# Altium project POD-Design-v1.1.PrjPcb (part 6 of 6)
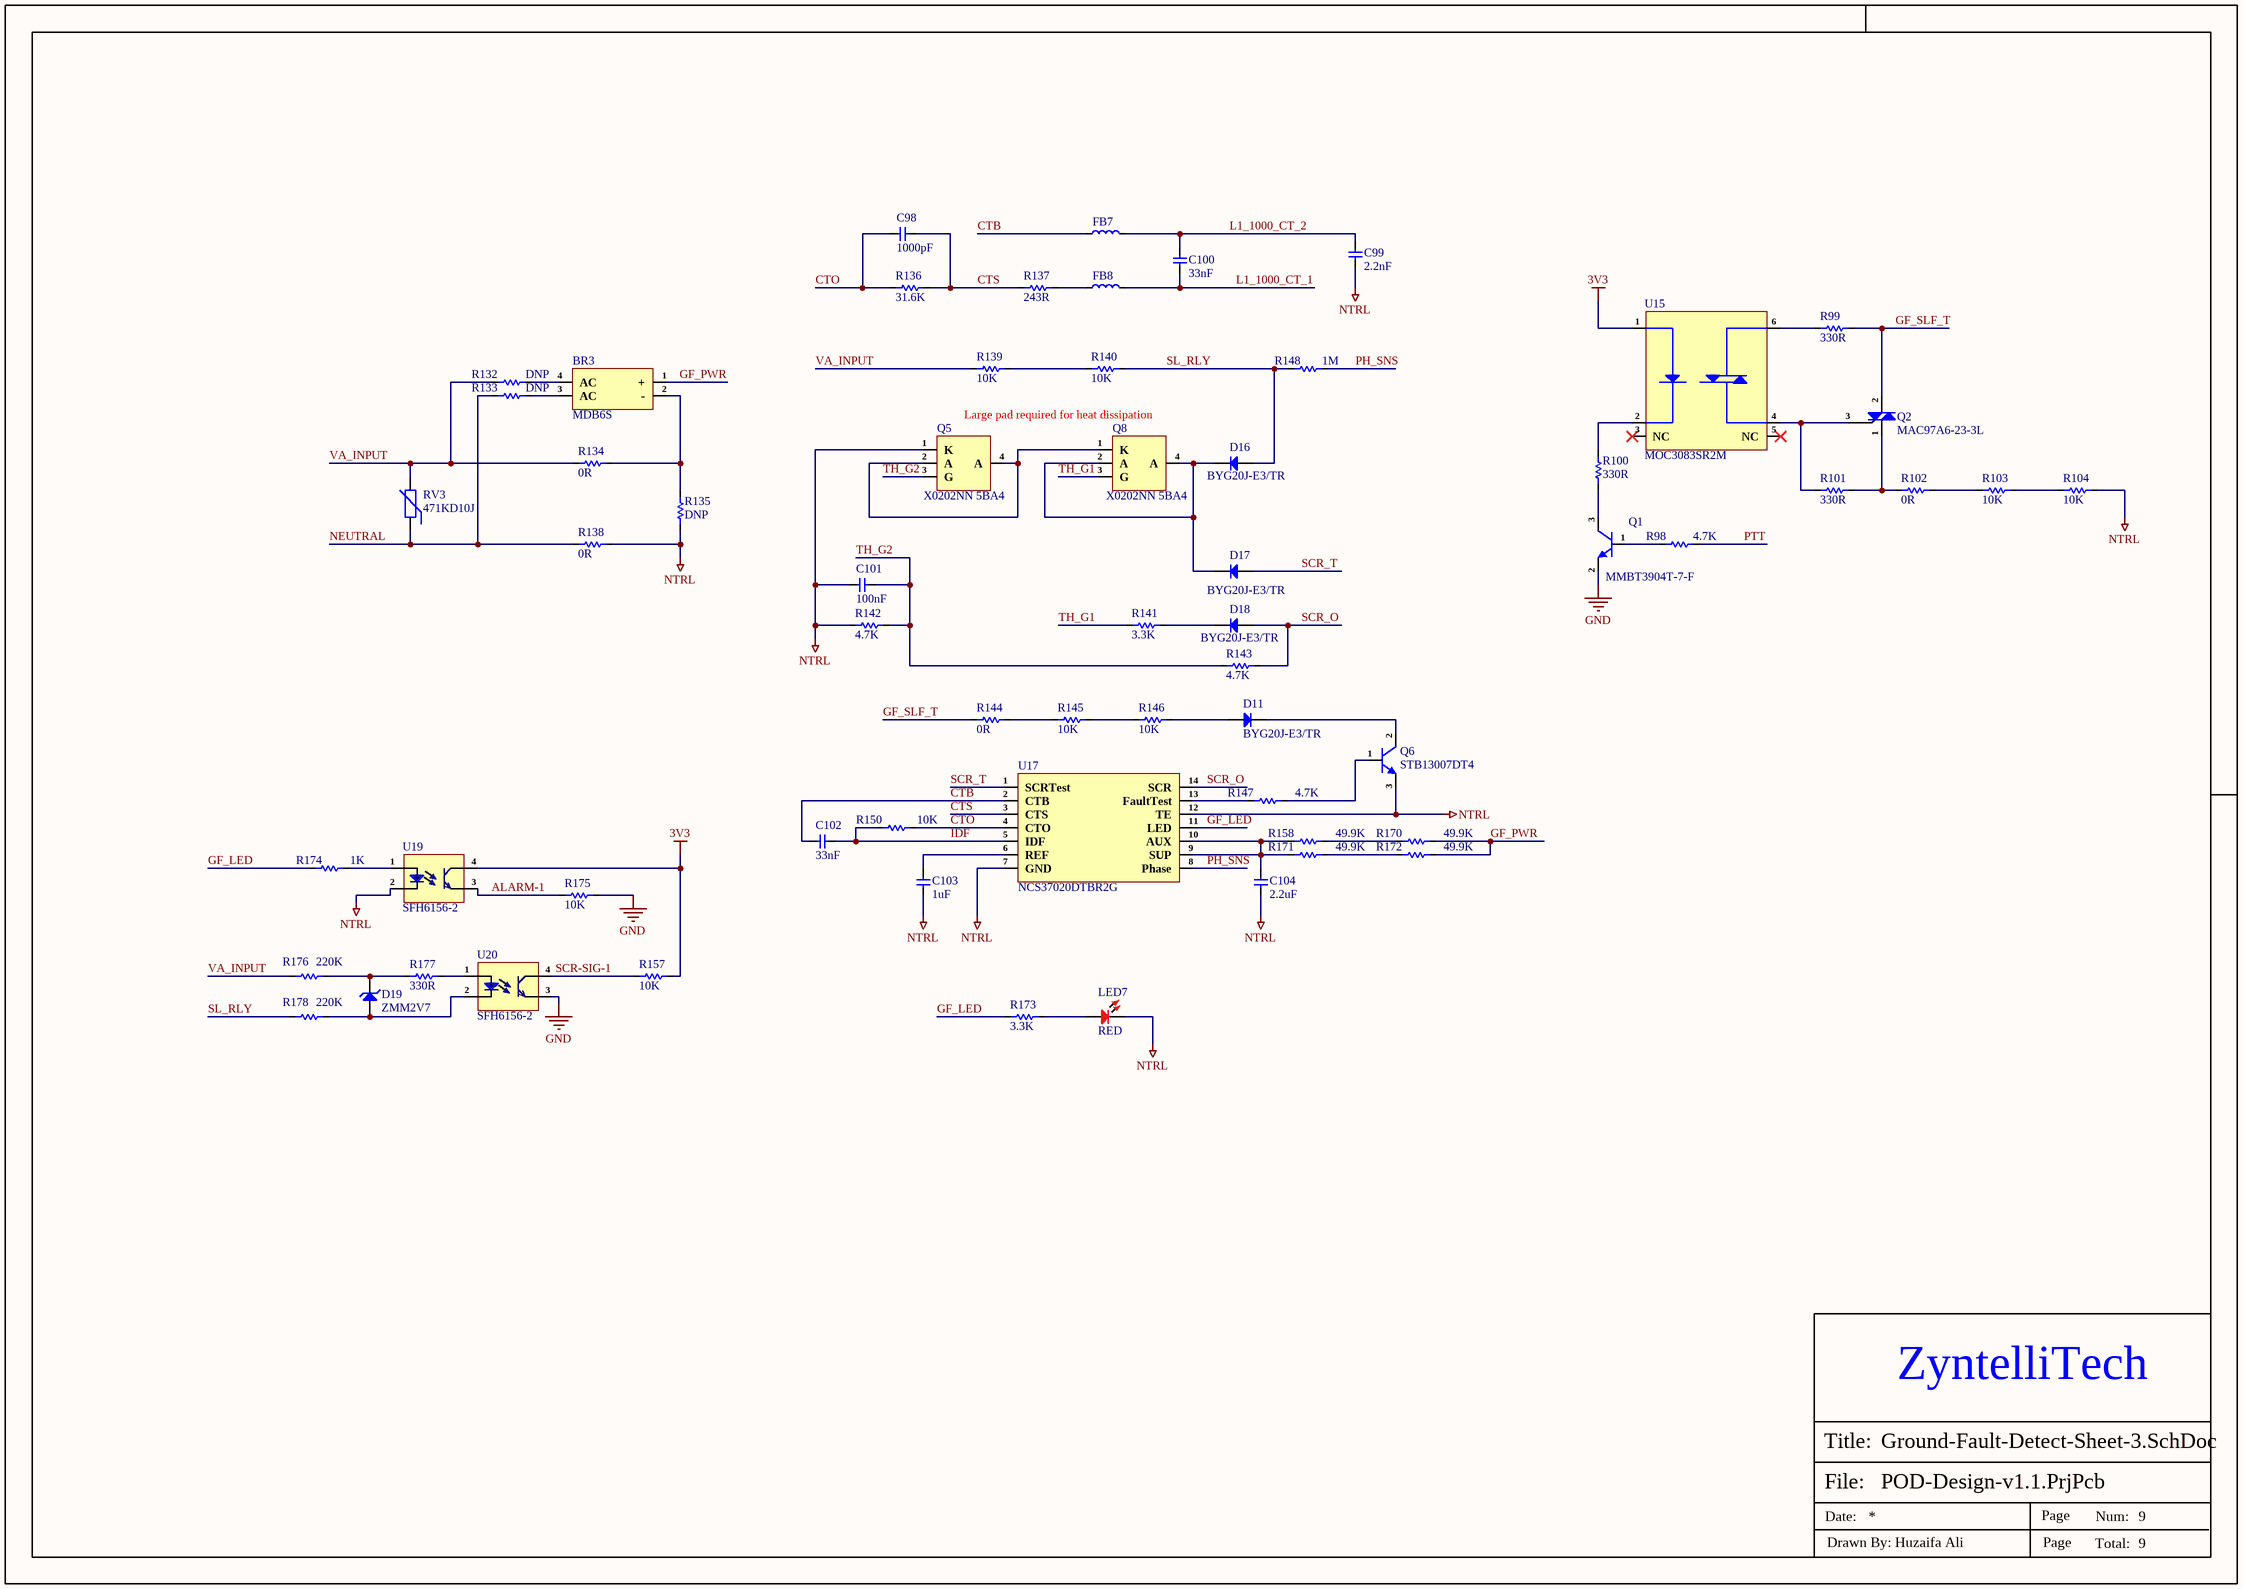
[diagram p10: Ground-Fault-Detect-Sheet-3.SchDoc]

## Sheet Ground-Fault-Detect-Sheet-3.SchDoc (continued)

### Library data of the parts (continued)
U15 = MOC3083SR2M: OPTOISOLATOR 4.17KV TRIAC 6SMD; Manufacturer: ON Semiconductor / Fairchild; Number of Channels: 1; Hold Current: 500uA; Nominal Supply Voltage: 1.3V; Max Supply Voltage: 1.5V; Forward Current: 60mA; Output Voltage: 800V; Reverse Breakdown Voltage: 6V; Max Power Dissipation: 250mW; Isolation Voltage: 4.2kV; Isolation Voltage-Max: 7.5kV; Item Type: IC; Supplier: Future Electronics; LCSC Part Number: C111561; Manufacturer Part Number: MOC3083SR2M; RoHS: Yes; Stock: 26000; Pricing: 1000=0.365, 2000=0.355, 3000=0.35, 4000=0.345, 5000=0.335 (USD); Mounting Technology: Surface Mount; Case/Package: SMD/SMT; Pins: 6; Weight: 0.81g; Min Operating Temperature: -40°C; Max Operating Temperature: 85°C; Packaging: Tape and Reel; Forward Voltage: 1.3V; Max Input Current: 60mA; Number of Elements: 1; Power Dissipation: 250mW; Max Output Voltage: 800V; Input Current: 60mA; Number of Circuits: 1; Series: -; Reverse Voltage: 6V; Height: 4.8mm; Radiation Hardening: No; Reach SVHC Compliant: No; Lead Free: Lead Free; RoHS Compliant: Yes; ComponentLink1URL: https://datasheet.ciiva.com/25620/0900766b810df541-25620726.pdf?src-supplier=Rs; ComponentLink1Description: https://datasheet.ciiva.com/25620/0900766b810df541-25620726.pdf?src-supplier=Rs; ComponentLink2URL: https://datasheet.ciiva.com/15118/getdatasheetpartid-67311-15118215.pdf?src-supplier=Verical; ComponentLink2Description: https://datasheet.ciiva.com/15118/getdatasheetpartid-67311-15118215.pdf?src-supplier=Verical; ComponentLink3URL: https://datasheet.ciiva.com/2093/moc3083m-2093280.pdf?src-supplier=Digikey; ComponentLink3Description: https://datasheet.ciiva.com/2093/moc3083m-2093280.pdf?src-supplier=Digikey; ComponentLink4URL: https://datasheet.ciiva.com/16744/moc3083m-16744701.pdf?src-supplier=Future+Electronics; ComponentLink4Description: https://datasheet.ciiva.com/16744/moc3083m-16744701.pdf?src-supplier=Future+Electronics; ComponentLink5URL: https://datasheet.ciiva.com/8099/moc3081m-8099621.pdf?src-supplier=Avnet; ComponentLink5Description: https://datasheet.ciiva.com/8099/moc3081m-8099621.pdf?src-supplier=Avnet; ComponentLink6URL: https://datasheet.ciiva.com/2093/moc3083m-2093279.pdf?src-supplier=Digikey; ComponentLink6Description: https://datasheet.ciiva.com/2093/moc3083m-2093279.pdf?src-supplier=Digikey; ComponentLink7URL: https://datasheet.ciiva.com/2093/moc3083m-2093278.pdf?src-supplier=Digikey; ComponentLink7Description: https://datasheet.ciiva.com/2093/moc3083m-2093278.pdf?src-supplier=Digikey
U17 = NCS37020DTBR2G: IC SIGNAL PROCESSOR 14TSSOP; Manufacturer: onsemi; Manufacturer Lifecycle Status: ACTIVE; Item Type: Sensor and Detector Interfaces; Max Supply Current: 10mA; Max Supply Voltage: 13V; Operating Supply Voltage: 12V; Supplier: DigiKey; LCSC Part Number: C904570; Manufacturer Part Number: NCS37020DTBR2G; RoHS: Compliant; Stock: 2623; Pricing: 1=0.99, 10=0.713, 25=0.6436, 100=0.5668, 250=0.53028, 500=0.50824, 1000=0.4901 (USD); China RoHS: Compliant; Height - Seated (Max): 1.2mm; Length: 5mm; Lifecycle Status: Production; Max Operating Temperature: 70°C; Min Operating Temperature: 0°C; Number of Terminals: 14; REACH SVHC: Yes; Terminal Pitch: 650µm; Width: 4.4mm; ComponentLink1URL: https://datasheet.octopart.com:443/NCS37020DTBR2G-onsemi-datasheet-180965843.pdf?src-supplier=IHS; ComponentLink1Description: https://datasheet.octopart.com:443/NCS37020DTBR2G-onsemi-datasheet-180965843.pdf?src-supplier=IHS; ComponentLink2URL: https://datasheet.octopart.com:443/NCS37020DTBR2G-ON-Semiconductor-datasheet-139012421.pdf?src-supplier=Master+Electronics; ComponentLink2Description: https://datasheet.octopart.com:443/NCS37020DTBR2G-ON-Semiconductor-datasheet-139012421.pdf?src-supplier=Master+Electronics; ComponentLink3URL: https://datasheet.octopart.com:443/NCS37020DTBR2G-ON-Semiconductor-datasheet-137129895.pdf?src-supplier=onsemi; ComponentLink3Description: https://datasheet.octopart.com:443/NCS37020DTBR2G-ON-Semiconductor-datasheet-137129895.pdf?src-supplier=onsemi; ComponentLink4URL: http://sigma.octopart.com:80/reach_statement/ON-Semiconductor-company-79.pdf?src-supplier=Compliance+Statements; ComponentLink4Description: http://sigma.octopart.com:80/reach_statement/ON-Semiconductor-company-79.pdf?src-supplier=Compliance+Statements; ComponentLink5URL: https://octopart.com:443/opatz8j6/c1?t=ZQW9HMtH4k71rWyV6AJY4tuW3XheiTOPmjmobTXB_F26sMcwWMhmH10pq7sQJYBRXfGSHYWRpmqpvFarTcJ6IR5mJHNE_a9wC_wytZDRLioJeZ7QsJAeRfWIGI1BjBRFqUYimvJtzLjCjz17RDpSBx7XSL-tIesgpAoA9dkWd1QvjggH5Lf3PglFk8Jmj008jqbUnKitEB1RpbYA_80My9UupV7zL5uwbriqM9u8ka-eDVP0HHlgEyvlk90TkPkxt1apKx9jOG4F6f6WcXkBfOtrxuHJ_x8hryS4-VTjD0u0BN_yaFUAv4LE__5U5qDUiotF1QbODTNZ71WeSvwhQDdPzE4qpMHglnhuqzT235XeMYg&src-supplier=Compliance+Statements; ComponentLink5Description: https://octopart.com:443/opatz8j6/c1?t=ZQW9HMtH4k71rWyV6AJY4tuW3XheiTOPmjmobTXB_F26sMcwWMhmH10pq7sQJYBRXfGSHYWRpmqpvFarTcJ6IR5mJHNE_a9wC_wytZDRLioJeZ7QsJAeRfWIGI1BjBRFqUYimvJtzLjCjz17RDpSBx7XSL-tIesgpAoA9dkWd1QvjggH5Lf3PglFk8Jmj008jqbUnKitEB1RpbYA_80My9UupV7zL5uwbriqM9u8ka-eDVP0HHlgEyvlk90TkPkxt1apKx9jOG4F6f6WcXkBfOtrxuHJ_x8hryS4-VTjD0u0BN_yaFUAv4LE__5U5qDUiotF1QbODTNZ71WeSvwhQDdPzE4qpMHglnhuqzT235XeMYg&src-supplier=Compliance+Statements; ComponentLink6URL: https://octopart.com:443/opatz8j6/c1?t=HismN954h6fGmh9fmuQcgXhTaW1LIpJi1zfdE4ekLkTpZNiJX5OuPT8uhS35awRxYVrPSlueGbHyRXMTAgi5oFyNekVsRZ8Wf8rZ0DBuUfKFuVTFVFD9ObD5jmIONxQZYnS7ApbkheX8jjM_HLR7wXao3cq_nbkOSh1zihM_Cb25b-mOFKzO57l-cPraBIcXhIIoS2L5CzwghySSn828_I70UIOuSkvLkmcdjxM7wbVRBzaqQtktMNEHz6OXR8jKrzYQQpbeYqdyN6vjnc-d046VHgn1wFMO-_Mp3x6HmAFm7wxh74XFnntKtcXzz-IGW-eRo0i-X4dDM8t3zvT-QSalQbhBf0_OjmbV5ssDUWXnLg&src-supplier=Compliance+Statements; ComponentLink6Description: https://octopart.com:443/opatz8j6/c1?t=HismN954h6fGmh9fmuQcgXhTaW1LIpJi1zfdE4ekLkTpZNiJX5OuPT8uhS35awRxYVrPSlueGbHyRXMTAgi5oFyNekVsRZ8Wf8rZ0DBuUfKFuVTFVFD9ObD5jmIONxQZYnS7ApbkheX8jjM_HLR7wXao3cq_nbkOSh1zihM_Cb25b-mOFKzO57l-cPraBIcXhIIoS2L5CzwghySSn828_I70UIOuSkvLkmcdjxM7wbVRBzaqQtktMNEHz6OXR8jKrzYQQpbeYqdyN6vjnc-d046VHgn1wFMO-_Mp3x6HmAFm7wxh74XFnntKtcXzz-IGW-eRo0i-X4dDM8t3zvT-QSalQbhBf0_OjmbV5ssDUWXnLg&src-supplier=Compliance+Statements
U19 U20 = SFH6156-2: OPTOISOLATOR 5.3KV TRANS 4SMD; Manufacturer: Vishay; Item Type: IC; Supplier: Mouser; LCSC Part Number: C5156027; Manufacturer Part Number: SFH6156-2; RoHS: No; Stock: 11480; Pricing: 1=0.56, 10=0.37, 50=0.37, 100=0.253, 1000=0.218, 10000=0.217 (USD)

## Nets that join several sheets
3V3: AC-Measurement-Sheet-1 (6 pins), BLE-MCU-Sheet (R54.1), Power-Sheet (7 pins), Battery-Charging-Sheet (R76.1), Motion-Temp-Sensor-Sheet (7 pins), DC-Measurement-Sheet (8 pins), Ground-Fault-Detect-Sheet-3 (R157.1 U15.1 U19.4)
3V3-IS: AC-Measurement-Sheet-1 (12 pins), Power-Sheet (C62.2 U7.4)
GND: AC-Measurement-Sheet-1 (6 pins), BLE-MCU-Sheet (30 pins), Power-Sheet (13 pins), Battery-Charging-Sheet (21 pins), Motion-Temp-Sensor-Sheet (8 pins), DC-Measurement-Sheet (18 pins), Ground-Fault-Detect-Sheet-3 (Q1.2 R175.1 U20.3)
NGND: AC-Measurement-Sheet-1 (58 pins), AC-Measurement-Sheet-2 (13 pins), Power-Sheet (C62.1 U7.3)
VA_N: AC-Measurement-Sheet-1 (U1.19), AC-Measurement-Sheet-2 (C26.2 C28.2 R35.2)
VA_P: AC-Measurement-Sheet-1 (U1.20), AC-Measurement-Sheet-2 (C26.1 C27.2 R33.2 R34.2)
VB_N: AC-Measurement-Sheet-1 (U1.21), AC-Measurement-Sheet-2 (C29.2 C31.2 R41.2)
VB_P: AC-Measurement-Sheet-1 (U1.22), AC-Measurement-Sheet-2 (C29.1 C30.2 R39.2 R40.2)
VBAT: Power-Sheet (U5.6), Battery-Charging-Sheet (7 pins)
VBUS: BLE-MCU-Sheet (C54.2 U3.AD2), Power-Sheet (R68.2 R70.2 U5.3 U5.5), Battery-Charging-Sheet (5 pins)
VC_N: AC-Measurement-Sheet-1 (U1.23), AC-Measurement-Sheet-2 (C32.2 C34.2 R47.2)
VC_P: AC-Measurement-Sheet-1 (U1.24), AC-Measurement-Sheet-2 (C32.1 C33.2 R45.2 R46.2)
ACCEL_CS: BLE-MCU-Sheet (R64.2), Motion-Temp-Sensor-Sheet (R79.1 U12.7)
ACCEL_INT: BLE-MCU-Sheet (R63.2), Motion-Temp-Sensor-Sheet (R78.1 U12.8)
ALARM-1: BLE-MCU-Sheet (R92.2), Ground-Fault-Detect-Sheet-3 (R175.2 U19.3)
BAT_ALERT: BLE-MCU-Sheet (R62.2), Battery-Charging-Sheet (R76.2 U10.5)
CF3: AC-Measurement-Sheet-1 (U18.12), BLE-MCU-Sheet (R168.2)
CF4: AC-Measurement-Sheet-1 (U18.11), BLE-MCU-Sheet (R169.2)
DC_CUR_NEG: DC-Measurement-Sheet (U14.7), Connector-Sheet (J8.1)
DC_CUR_POS: DC-Measurement-Sheet (U14.8), Connector-Sheet (J7.1)
DC_VOLTS_NEG: DC-Measurement-Sheet (R87.1), Connector-Sheet (J2.14)
DC_VOLTS_POS: DC-Measurement-Sheet (R84.1), Connector-Sheet (J2.13)
GF_SLF_T: Connector-Sheet (J5.2), Ground-Fault-Detect-Sheet-3 (Q2.2 R99.2 R144.1)
I2C_SCL: BLE-MCU-Sheet (R56.2 R66.2), Battery-Charging-Sheet (U10.7), Motion-Temp-Sensor-Sheet (U11.2 U12.14), DC-Measurement-Sheet (U13.10)
I2C_SDA: BLE-MCU-Sheet (R55.2 R65.2), Battery-Charging-Sheet (U10.8), Motion-Temp-Sensor-Sheet (U11.3 U12.13), DC-Measurement-Sheet (U13.9)
IA_N1: AC-Measurement-Sheet-1 (D2.1 D2.2 R4.1 R5.1), Connector-Sheet (J2.7)
IA_P1: AC-Measurement-Sheet-1 (D1.1 D1.2 R1.1 R3.2), Connector-Sheet (J2.6)
IB_N1: AC-Measurement-Sheet-1 (D4.1 D4.2 R12.1 R13.1), Connector-Sheet (J2.9)
IB_P1: AC-Measurement-Sheet-1 (D3.1 D3.2 R9.1 R11.2), Connector-Sheet (J2.8)
IC_N1: AC-Measurement-Sheet-1 (D6.1 D6.2 R18.1 R19.1), Connector-Sheet (J2.11)
IC_P1: AC-Measurement-Sheet-1 (D5.1 D5.2 R15.1 R17.2), Connector-Sheet (J2.10)
IRQ0: AC-Measurement-Sheet-1 (U18.14), BLE-MCU-Sheet (R166.2)
IRQ1: AC-Measurement-Sheet-1 (U18.13), BLE-MCU-Sheet (R167.2)
L1_1000_CT_1: Connector-Sheet (J5.3), Ground-Fault-Detect-Sheet-3 (C100.2 FB8.2)
L1_1000_CT_2: Connector-Sheet (J5.4), Ground-Fault-Detect-Sheet-3 (C99.2 C100.1 FB7.2)
NEUTRAL: AC-Measurement-Sheet-2 (FB4.1), Connector-Sheet (J2.4), Ground-Fault-Detect-Sheet-3 (R133.1 R138.1 RV3.1)
PTT: BLE-MCU-Sheet (R95.2), Ground-Fault-Detect-Sheet-3 (R98.2)
PWR_STAT: BLE-MCU-Sheet (R61.2), Power-Sheet (R67.1 U5.8)
SCR-SIG-1: BLE-MCU-Sheet (R152.2), Ground-Fault-Detect-Sheet-3 (R157.2 U20.4)
SPI_MISO: AC-Measurement-Sheet-1 (U2.6), BLE-MCU-Sheet (R60.2)
SPI_MOSI: AC-Measurement-Sheet-1 (U2.5), BLE-MCU-Sheet (R59.2)
SPI_SCK: AC-Measurement-Sheet-1 (U2.4), BLE-MCU-Sheet (R58.2)
SPI_SS: AC-Measurement-Sheet-1 (U2.3), BLE-MCU-Sheet (R57.2)
TYPEC_N: BLE-MCU-Sheet (U3.AD4), Battery-Charging-Sheet (U8.6)
TYPEC_P: BLE-MCU-Sheet (U3.AD6), Battery-Charging-Sheet (U8.4)
VA_INPUT: AC-Measurement-Sheet-2 (FB1.1), Connector-Sheet (J2.1), Ground-Fault-Detect-Sheet-3 (5 pins)
VB_INPUT: AC-Measurement-Sheet-2 (FB2.1), Connector-Sheet (J2.2)
VC_INPUT: AC-Measurement-Sheet-2 (FB3.1), Connector-Sheet (J2.3)